# EAGLE design PCB_ESP32_v15 (EAGLE 9.7.0)
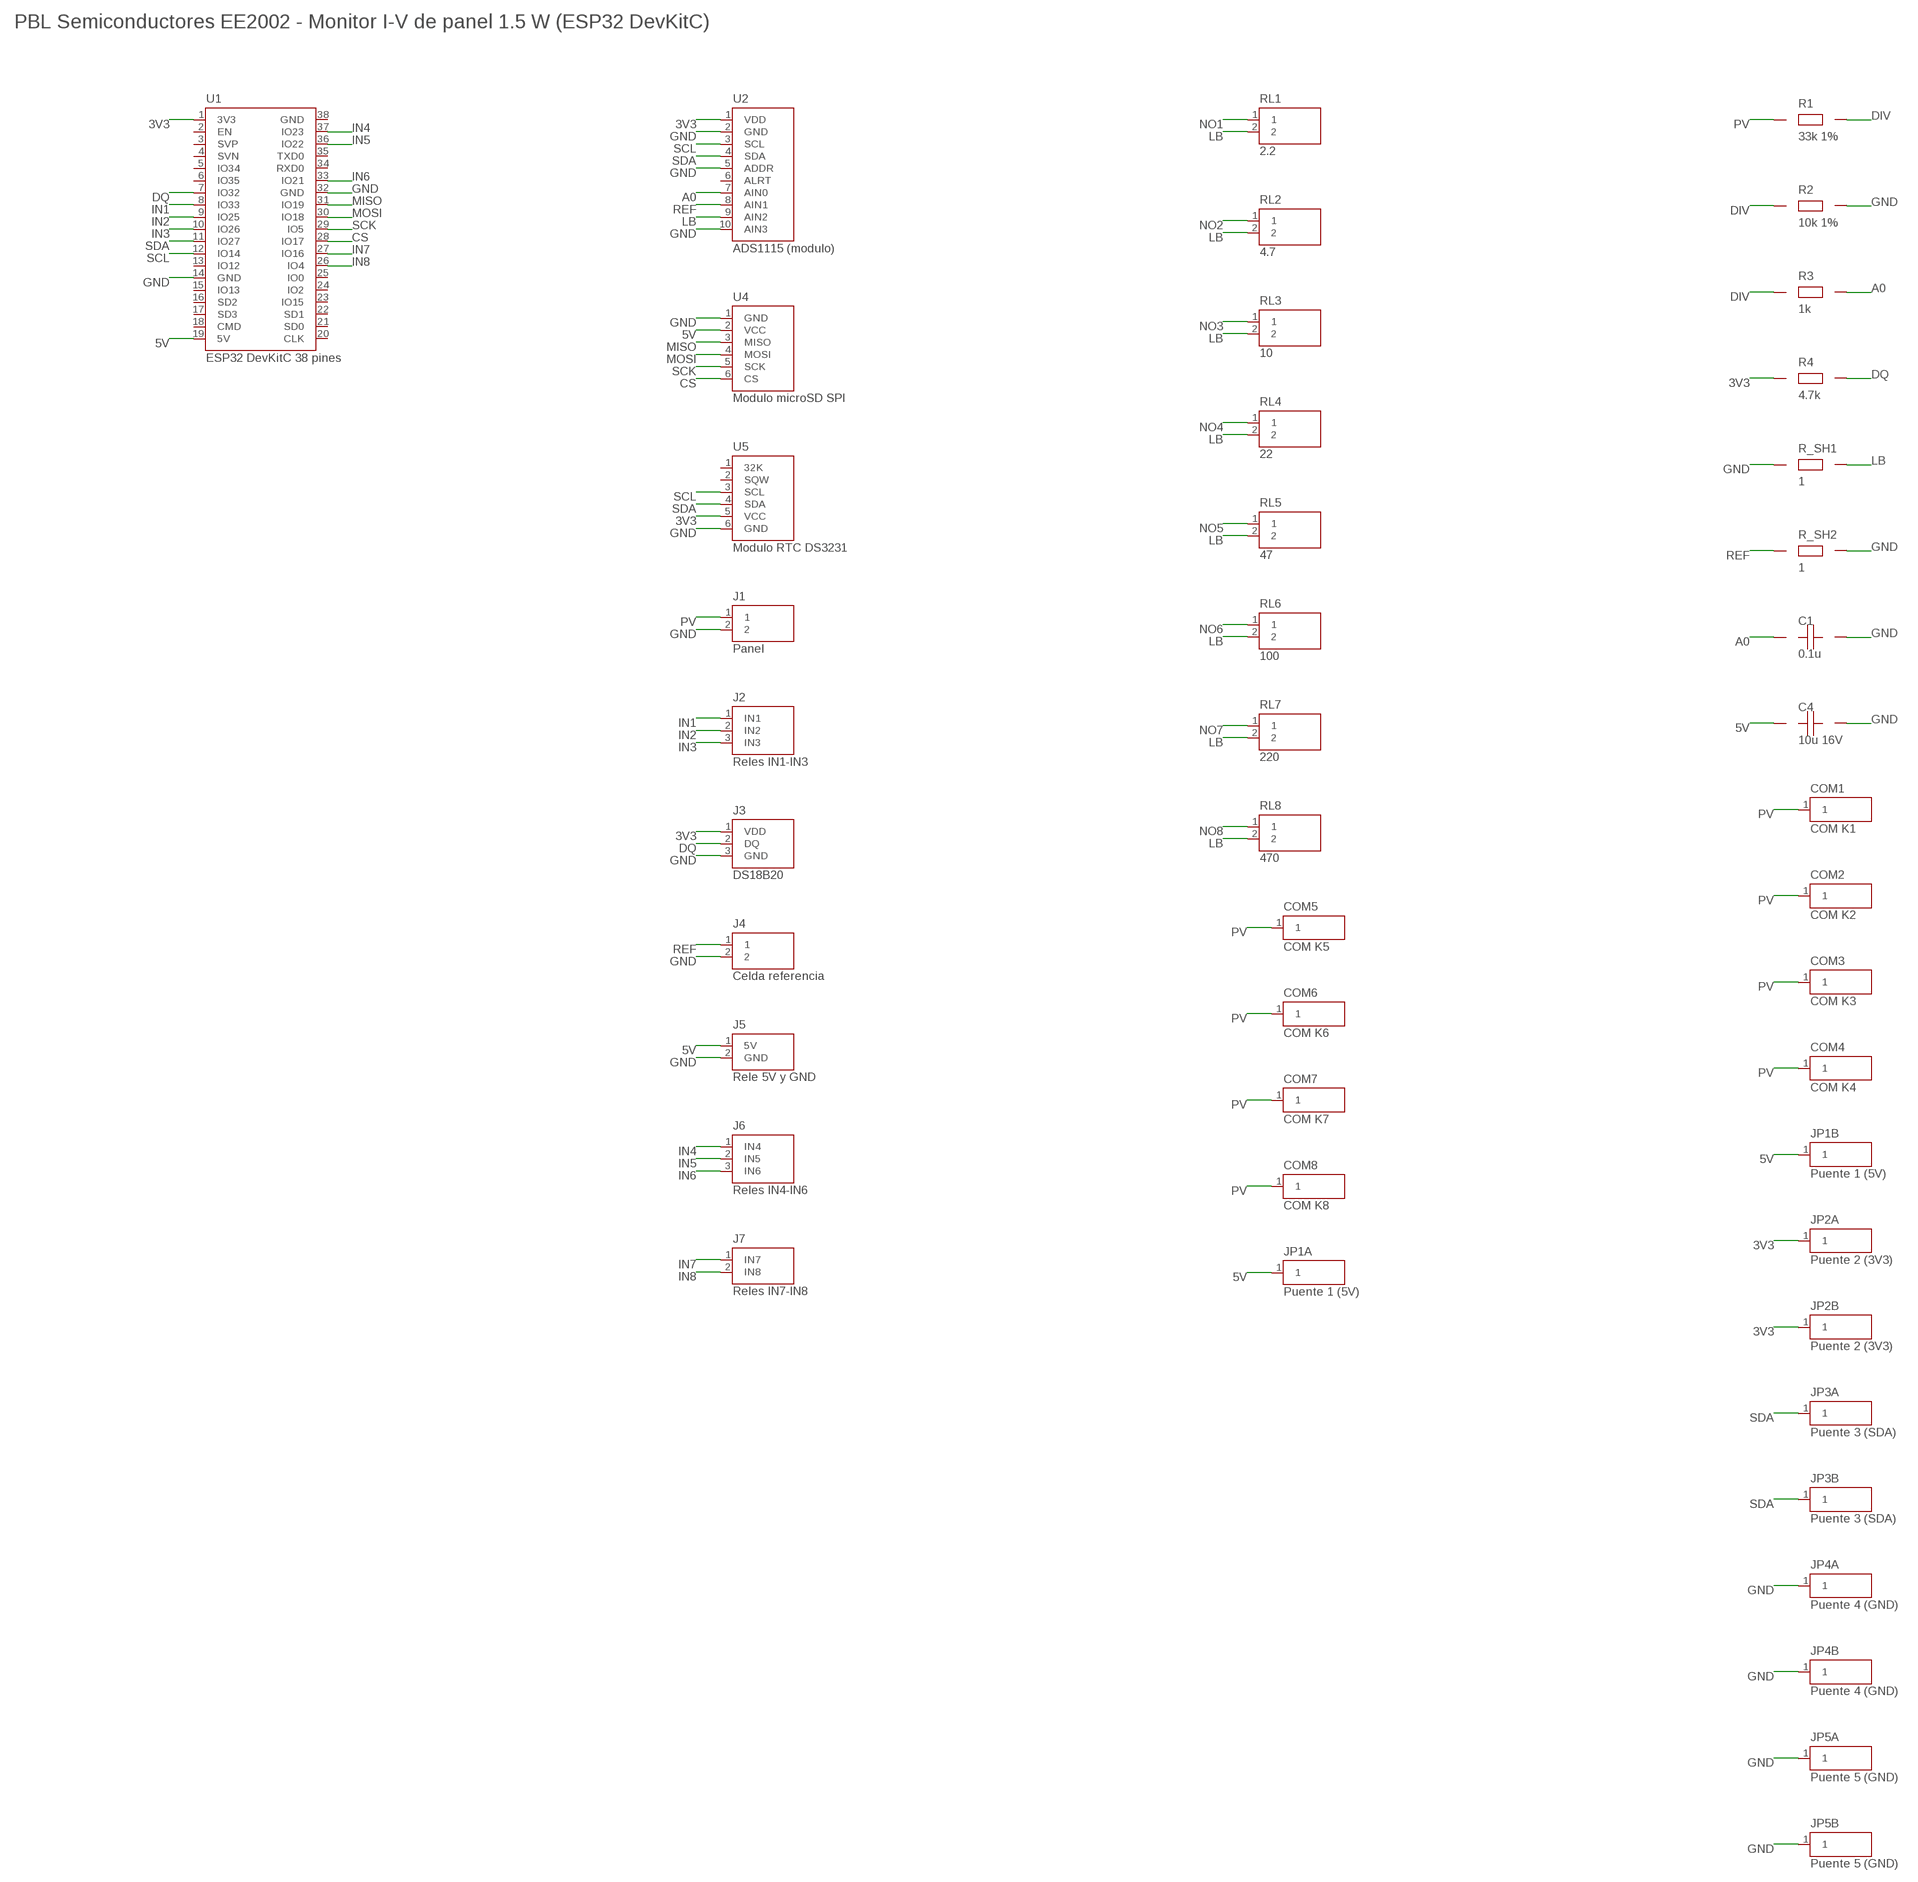
[diagram p0: schematic, sheet 1]

## Parts
C1  0.1u  C  [CAP_5MM]
C4  10u 16V  CP  [CAP_E_2_54]
COM1  COM K1  WIREPAD  [WIREPAD]
COM2  COM K2  WIREPAD  [WIREPAD]
COM3  COM K3  WIREPAD  [WIREPAD]
COM4  COM K4  WIREPAD  [WIREPAD]
COM5  COM K5  WIREPAD  [WIREPAD]
COM6  COM K6  WIREPAD  [WIREPAD]
COM7  COM K7  WIREPAD  [WIREPAD]
COM8  COM K8  WIREPAD  [WIREPAD]
J1  Panel  TERM2  [TERM2_5MM]
J2  Reles IN1-IN3  RELAY_L  [MALE_1X03]
J3  DS18B20  DS18B20_HDR  [MALE_1X03]
J4  Celda referencia  TERM2  [TERM2_5MM]
J5  Rele 5V y GND  RELAY_PWR  [MALE_1X02]
J6  Reles IN4-IN6  RELAY_RA  [MALE_1X03]
J7  Reles IN7-IN8  RELAY_RC  [MALE_1X02]
JP1A  Puente 1 (5V)  JPAD  [JPAD]
JP1B  Puente 1 (5V)  JPAD  [JPAD]
JP2A  Puente 2 (3V3)  JPAD  [JPAD]
JP2B  Puente 2 (3V3)  JPAD  [JPAD]
JP3A  Puente 3 (SDA)  JPAD  [JPAD]
JP3B  Puente 3 (SDA)  JPAD  [JPAD]
JP4A  Puente 4 (GND)  JPAD  [JPAD]
JP4B  Puente 4 (GND)  JPAD  [JPAD]
JP5A  Puente 5 (GND)  JPAD  [JPAD]
JP5B  Puente 5 (GND)  JPAD  [JPAD]
R1  33k 1%  R  [RES_V]
R2  10k 1%  R  [RES_V]
R3  1k  R  [RES_V]
R4  4.7k  R  [RES_V]
R_SH1  1  R  [RES_V]
R_SH2  1  R  [RES_V]
RL1  2.2  RLOAD  [RES_H_T]
RL2  4.7  RLOAD  [RES_H_T]
RL3  10  RLOAD  [RES_H_T]
RL4  22  RLOAD  [RES_H_T]
RL5  47  RLOAD  [RES_H_T]
RL6  100  RLOAD  [RES_H_T]
RL7  220  RLOAD  [RES_H_T]
RL8  470  RLOAD  [RES_H_T]
U1  ESP32 DevKitC 38 pines  ESP32  [ESP32_DEVKIT38]
U2  ADS1115 (modulo)  ADS1115  [SOCKET_1X10]
U4  Modulo microSD SPI  SDCARD  [SOCKET_1X06]
U5  Modulo RTC DS3231  DS3231  [SOCKET_1X06]

## Nets
3V3: J3.1(VDD) JP2A.1 JP2B.1 R4.1 U1.1(3V3) U2.1(VDD) U5.5(VCC)
5V: C4.1(+) J5.1(5V) JP1A.1 JP1B.1 U1.19(5V) U4.2(VCC)
A0: C1.1 R3.2 U2.7(AIN0)
CS: U1.28(IO17) U4.6(CS)
DIV: R1.2 R2.1 R3.1
DQ: J3.2(DQ) R4.2 U1.7(IO32)
GND: C1.2 C4.2(-) J1.2 J3.3(GND) J4.2 J5.2(GND) JP4A.1 JP4B.1 JP5A.1 JP5B.1 R2.2 R_SH1.1 R_SH2.2 U1.14(GND) U1.32(GND) U2.2(GND) U2.5(ADDR) U2.10(AIN3) U4.1(GND) U5.6(GND)
IN1: J2.1(IN1) U1.8(IO33)
IN2: J2.2(IN2) U1.9(IO25)
IN3: J2.3(IN3) U1.10(IO26)
IN4: J6.1(IN4) U1.37(IO23)
IN5: J6.2(IN5) U1.36(IO22)
IN6: J6.3(IN6) U1.33(IO21)
IN7: J7.1(IN7) U1.27(IO16)
IN8: J7.2(IN8) U1.26(IO4)
LB: R_SH1.2 RL1.2 RL2.2 RL3.2 RL4.2 RL5.2 RL6.2 RL7.2 RL8.2 U2.9(AIN2)
MISO: U1.31(IO19) U4.3(MISO)
MOSI: U1.30(IO18) U4.4(MOSI)
NO1: RL1.1
NO2: RL2.1
NO3: RL3.1
NO4: RL4.1
NO5: RL5.1
NO6: RL6.1
NO7: RL7.1
NO8: RL8.1
PV: COM1.1 COM2.1 COM3.1 COM4.1 COM5.1 COM6.1 COM7.1 COM8.1 J1.1 R1.1
REF: J4.1 R_SH2.1 U2.8(AIN1)
SCK: U1.29(IO5) U4.5(SCK)
SCL: U1.12(IO14) U2.3(SCL) U5.3(SCL)
SDA: JP3A.1 JP3B.1 U1.11(IO27) U2.4(SDA) U5.4(SDA)
Unconnected: U1.2(EN) U1.3(SVP) U1.4(SVN) U1.5(IO34) U1.6(IO35) U1.13(IO12) U1.15(IO13) U1.16(SD2) U1.17(SD3) U1.18(CMD) U1.20(CLK) U1.21(SD0) U1.22(SD1) U1.23(IO15) U1.24(IO2) U1.25(IO0) U1.34(RXD0) U1.35(TXD0) U1.38(GND) U2.6(ALRT) U5.1(32K) U5.2(SQW)

## Notes on the sheet
- PBL Semiconductores EE2002 - Monitor I-V de panel 1.5 W (ESP32 DevKitC)

## Library data of the parts
C1 = PCB_PBL_Semiconductores:C
C4 = PCB_PBL_Semiconductores:CP
COM1-COM8 = PCB_PBL_Semiconductores:WIREPAD
J1 J4 = PCB_PBL_Semiconductores:TERM2
J2 = PCB_PBL_Semiconductores:RELAY_L
J3 = PCB_PBL_Semiconductores:DS18B20_HDR
J5 = PCB_PBL_Semiconductores:RELAY_PWR
J6 = PCB_PBL_Semiconductores:RELAY_RA
J7 = PCB_PBL_Semiconductores:RELAY_RC
JP1A JP1B JP2A JP2B JP3A JP3B JP4A JP4B JP5A JP5B = PCB_PBL_Semiconductores:JPAD
R1-R4 R_SH1 R_SH2 = PCB_PBL_Semiconductores:R
RL1-RL8 = PCB_PBL_Semiconductores:RLOAD
U1 = PCB_PBL_Semiconductores:ESP32
U2 = PCB_PBL_Semiconductores:ADS1115
U4 = PCB_PBL_Semiconductores:SDCARD
U5 = PCB_PBL_Semiconductores:DS3231

## Board
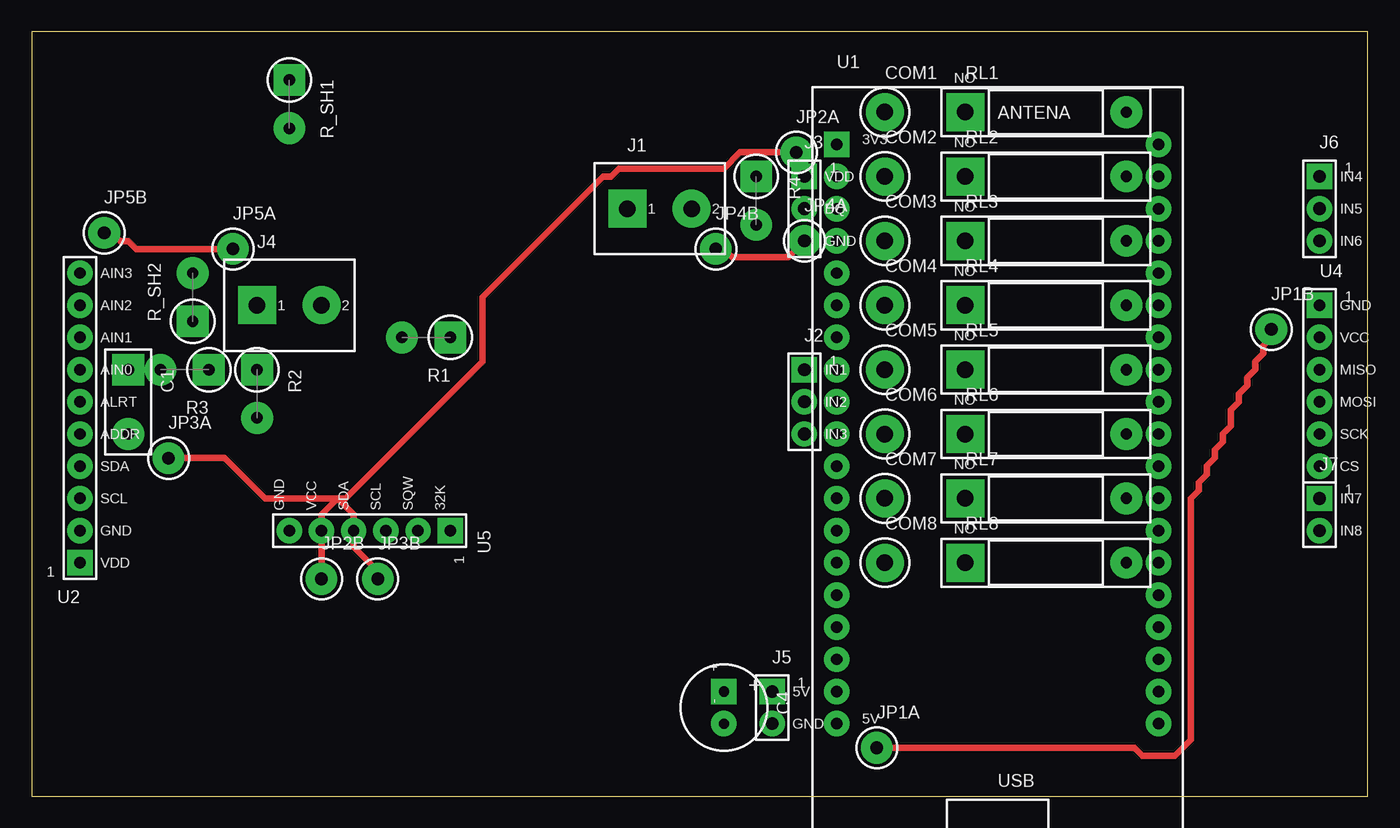
[diagram p1: board, top side]
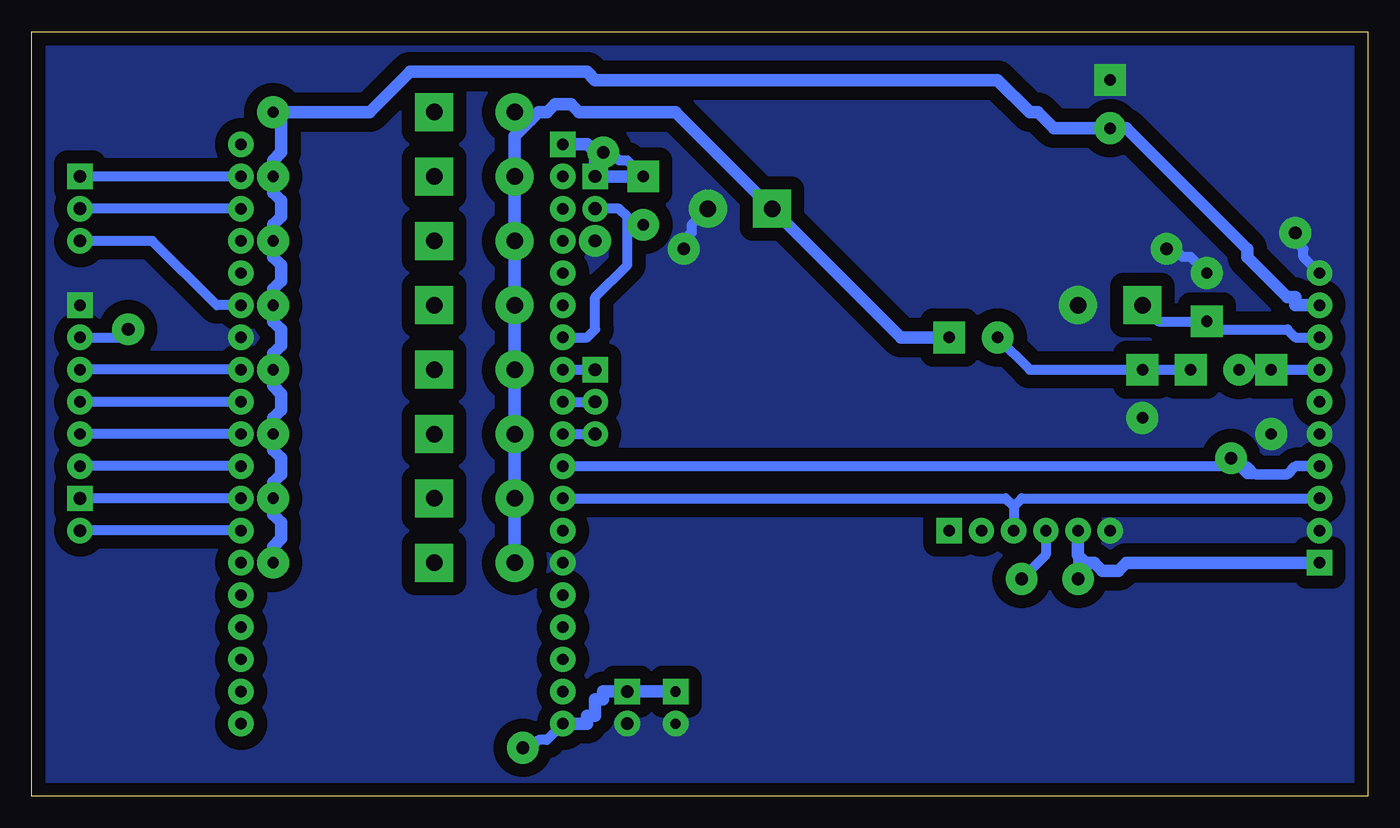
[diagram p2: board, bottom side, seen from below]

Size 105.41 x 60.32 mm. Coordinates in mm from the lower left corner, seen from the top.
Outline: 0,0 105.41,0 105.41,60.32 0,60.32 0,0
Copper layers (1*16): Top 0.035mm / dielectric 1.5mm / Bottom 0.035mm
Design rules "Fusion Electronics Design Rules": minimum track width 0.8mm, minimum drill 0.8mm, track to track 0.9mm, track to pad 0.9mm, pad to pad 0.4mm, via to via 0.4mm, smd to smd 6mil, copper to edge 1mm, drill to drill 0.3mm, minimum pad ring 0.4mm, minimum via ring 0.4mm, stop-mask expansion 4mil, vias tented up to drill 9999mil, thermal gap 0.6mm

### Footprints (pad centres in the part's own frame; a part is rotated, then mirrored left to right if it is on the bottom)
CAP_5MM = drill 0.9 pad 2.5 square: 1 0,0 | drill 0.9 pad 2.5 round: 2 5.08,0
CAP_E_2_54 = drill 0.8 pad 2 square: 1 0,0 | drill 0.8 pad 2 round: 2 2.54,0
WIREPAD = drill 1.3 pad 3 round: 1 0,0
TERM2_5MM = drill 1.3 pad 3 square: 1 0,0 | drill 1.3 pad 3 round: 2 5.08,0
MALE_1X03 = drill 1 pad 2 square: 1 0,0 | drill 1 pad 2 round: 2 0,-2.54; 3 0,-5.08
MALE_1X02 = drill 1 pad 2 square: 1 0,0 | drill 1 pad 2 round: 2 0,-2.54
JPAD = drill 1 pad 2.5 round: 1 0,0
RES_V = drill 0.9 pad 2.5 square: 1 0,0 | drill 0.9 pad 2.5 round: 2 3.81,0
RES_H_T = drill 1.3 pad 3 square: 1 0,0 | drill 0.9 pad 2.5 round: 2 12.7,0
ESP32_DEVKIT38 = drill 0.9 pad 2 square: 1 0,0 | drill 0.9 pad 2 round: 2 0,-2.54; 3 0,-5.08; 4 0,-7.62; 5 0,-10.16; 6 0,-12.7; 7 0,-15.24; 8 0,-17.78; 9 0,-20.32; 10 0,-22.86; 11 0,-25.4; 12 0,-27.94; 13 0,-30.48; 14 0,-33.02; 15 0,-35.56; 16 0,-38.1; 17 0,-40.64; 18 0,-43.18; 19 0,-45.72; 20 25.4,-45.72; 21 25.4,-43.18; 22 25.4,-40.64; 23 25.4,-38.1; 24 25.4,-35.56; 25 25.4,-33.02; 26 25.4,-30.48; 27 25.4,-27.94; 28 25.4,-25.4; 29 25.4,-22.86; 30 25.4,-20.32; 31 25.4,-17.78; 32 25.4,-15.24; 33 25.4,-12.7; 34 25.4,-10.16; 35 25.4,-7.62; 36 25.4,-5.08; 37 25.4,-2.54; 38 25.4,0
SOCKET_1X10 = drill 0.9 pad 2 square: 1 0,0 | drill 0.9 pad 2 round: 2 0,-2.54; 3 0,-5.08; 4 0,-7.62; 5 0,-10.16; 6 0,-12.7; 7 0,-15.24; 8 0,-17.78; 9 0,-20.32; 10 0,-22.86
SOCKET_1X06 = drill 0.9 pad 2 square: 1 0,0 | drill 0.9 pad 2 round: 2 0,-2.54; 3 0,-5.08; 4 0,-7.62; 5 0,-10.16; 6 0,-12.7

### Placement (x,y rotation side)
C1  7.62,33.66 270 top
C4  54.61,8.26 270 top
COM1  67.31,53.98 0 top
COM2  67.31,48.9 0 top
COM3  67.31,43.82 0 top
COM4  67.31,38.74 0 top
COM5  67.31,33.66 0 top
COM6  67.31,28.58 0 top
COM7  67.31,23.5 0 top
COM8  67.31,18.41 0 top
J1  46.99,46.35 0 top
J2  60.96,33.66 0 top
J3  60.96,48.9 0 top
J4  17.78,38.74 0 top
J5  58.42,8.26 0 top
J6  101.6,48.9 0 top
J7  101.6,23.5 0 top
JP1A  66.67,3.81 0 top
JP1B  97.79,36.83 0 top
JP2A  60.33,50.8 0 top
JP2B  22.86,17.15 0 top
JP3A  10.79,26.67 0 top
JP3B  27.3,17.15 0 top
JP4A  60.96,43.82 0 top
JP4B  53.98,43.18 0 top
JP5A  15.88,43.18 0 top
JP5B  5.71,44.45 0 top
R1  33.02,36.2 180 top
R2  17.78,33.66 270 top
R3  13.97,33.66 180 top
R4  57.15,48.9 270 top
R_SH1  20.32,56.52 270 top
R_SH2  12.7,37.46 90 top
RL1  73.66,53.98 0 top
RL2  73.66,48.9 0 top
RL3  73.66,43.82 0 top
RL4  73.66,38.74 0 top
RL5  73.66,33.66 0 top
RL6  73.66,28.58 0 top
RL7  73.66,23.5 0 top
RL8  73.66,18.41 0 top
U1  63.5,51.43 0 top
U2  3.81,18.41 180 top
U4  101.6,38.74 0 top
U5  33.02,20.96 270 top

### Tracks (layer width: path | path; a pad name or v marks a point on that pad's centre or on a via)
3V3
  Top 0.5: JP2A.1 55.88,50.8 54.61,49.53 46.35,49.53 45.72,48.9 45.09,48.9 35.56,39.37 35.56,34.29 24.77,23.5 24.13,23.5 22.86,22.23 JP2B.1
  Bottom 0.8: R4.1 58.42,50.16 59.05,50.16 59.69,50.8 JP2A.1 | U5.5 22.86,19.05 JP2B.1
  Bottom 1: U1.1 61.59,51.43 60.96,50.8 J3.1 R4.1 | U5.5 22.86,19.05 22.23,18.41 21.59,18.41 20.95,17.78 19.68,17.78 19.05,18.41 U2.1
5V
  Top 0.5: JP1A.1 87,3.81 87.63,3.18 90.17,3.18 91.44,4.45 91.44,23.5 92.08,24.13 92.08,24.77 92.71,25.4 92.71,26.04 93.34,26.67 93.34,27.3 93.98,27.94 93.98,28.58 94.61,29.21 94.61,30.48 95.25,31.12 95.25,31.75 95.89,32.38 95.89,33.02 96.52,33.66 96.52,34.29 97.16,34.93 97.16,35.56 97.79,36.2 JP1B.1
  Bottom 0.8: U1.19 64.77,4.45 65.41,4.45 66.04,3.81 JP1A.1 | U4.2 98.42,36.2 JP1B.1
  Bottom 1: U1.19 61.59,5.72 61.59,6.35 60.96,6.35 60.96,7.62 60.33,7.62 60.33,8.26 J5.1 C4.1
A0
  Bottom 0.8: R3.2 C1.1 U2.7
CS
  Bottom 0.8: U1.28 U4.6
DIV
  Bottom 0.8: R1.2 26.67,33.66 R2.1 R3.1
DQ
  Bottom 0.8: U1.7 61.59,36.2 60.96,36.83 60.96,39.37 58.42,41.91 58.42,45.09 | 58.42,45.09 58.42,45.72 59.05,46.35 J3.2 | 58.42,45.09 R4.2
GND
  Top 0.5: JP4A.1 59.69,42.55 55.24,42.55 54.61,43.18 JP4B.1 | JP5A.1 8.26,43.18 7.62,43.82 6.99,43.82 6.35,44.45 JP5B.1
  Bottom 0.8: J1.2 53.34,45.09 53.34,44.45 53.98,43.82 JP4B.1 | R_SH2.2 13.97,42.55 14.61,42.55 15.24,43.18 JP5A.1 | U2.10 5.08,42.55 5.08,43.18 5.71,43.82 JP5B.1
  pour Bottom (isolate 1.05, no thermals): 0.8,0.8 104.61,0.8 104.61,59.52 0.8,59.52
IN1
  Bottom 0.8: U1.8 J2.1
IN2
  Bottom 0.8: U1.9 J2.2
IN3
  Bottom 0.8: U1.10 J2.3
IN4
  Bottom 0.8: U1.37 J6.1
IN5
  Bottom 0.8: U1.36 J6.2
IN6
  Bottom 0.8: U1.33 90.81,38.74 95.89,43.82 J6.3
IN7
  Bottom 0.8: U1.27 J7.1
IN8
  Bottom 0.8: U1.26 J7.2
LB
  Bottom 1: U2.9 5.71,38.74 5.71,39.37 6.35,39.37 9.53,42.55 9.53,43.18 19.05,52.71 R_SH1.2 24.77,52.71 26.04,53.98 26.67,53.98 29.21,56.52 60.96,56.52 61.59,57.15 75.56,57.15 78.74,53.98 85.72,53.98 | 85.72,53.98 RL1.2 | 85.72,53.98 85.72,50.8 86.36,50.16 RL2.2 86.36,47.63 85.72,46.99 85.72,45.72 86.36,45.09 RL3.2 86.36,42.55 85.72,41.91 85.72,40.64 86.36,40.01 RL4.2 86.36,37.46 85.72,36.83 85.72,35.56 86.36,34.93 RL5.2 86.36,32.38 85.72,31.75 85.72,30.48 86.36,29.84 RL6.2 86.36,27.3 85.72,26.67 85.72,25.4 86.36,24.77 RL7.2 86.36,22.23 85.72,21.59 85.72,20.32 86.36,19.69 RL8.2
MISO
  Bottom 0.8: U1.31 U4.3
MOSI
  Bottom 0.8: U1.30 U4.4
PV
  Bottom 1: 66.04,53.34 65.41,53.98 64.77,53.98 64.14,54.61 62.87,54.61 62.23,53.98 54.61,53.98 J1.1 36.83,36.2 R1.1 | 66.04,53.34 67.31,52.07 COM2.1 COM3.1 COM4.1 COM5.1 COM6.1 COM7.1 COM8.1 | 66.04,53.34 66.67,53.98 COM1.1
REF
  Bottom 0.8: J4.1 16.51,37.46 R_SH2.1 12.06,36.83 6.35,36.83 5.71,36.2 U2.8
SCK
  Bottom 0.8: U1.29 U4.5
SCL
  Bottom 0.8: U1.12 28.57,23.5 27.94,22.86 | 27.94,22.86 U5.3 | 27.94,22.86 27.3,23.5 U2.3
SDA
  Top 0.5: JP3A.1 15.24,26.67 18.41,23.5 24.13,23.5 25.4,22.23 25.4,19.69 27.3,17.78 JP3B.1
  Bottom 0.8: U1.11 9.53,26.04 8.89,25.4 | 8.89,25.4 6.35,25.4 | 6.35,25.4 5.71,26.04 | 5.71,26.04 U2.4 5.71,26.04 | 5.71,26.04 6.35,25.4 | 6.35,25.4 8.89,25.4 | 8.89,25.4 9.53,25.4 JP3A.1 | U5.4 25.4,19.05 JP3B.1

### Text on the board
tPlace: VDD | IN4 | 1 | 2 | DQ | IN5 | GND | IN6 | AIN3 | AIN2 | 1 | 2 | GND | AIN1 | VCC | AIN0 | IN1 | MISO | ALRT | IN2 | MOSI | ADDR | IN3 | SCK | SDA | CS | SCL | GND | VCC | SDA | SCL | SQW | 32K | IN7 | GND | IN8 | VDD | + | - | 5V | GND